# Altium schematic sheet USB-C.SchDoc
size A4; SheetNumber: 3; SheetTotal: 5
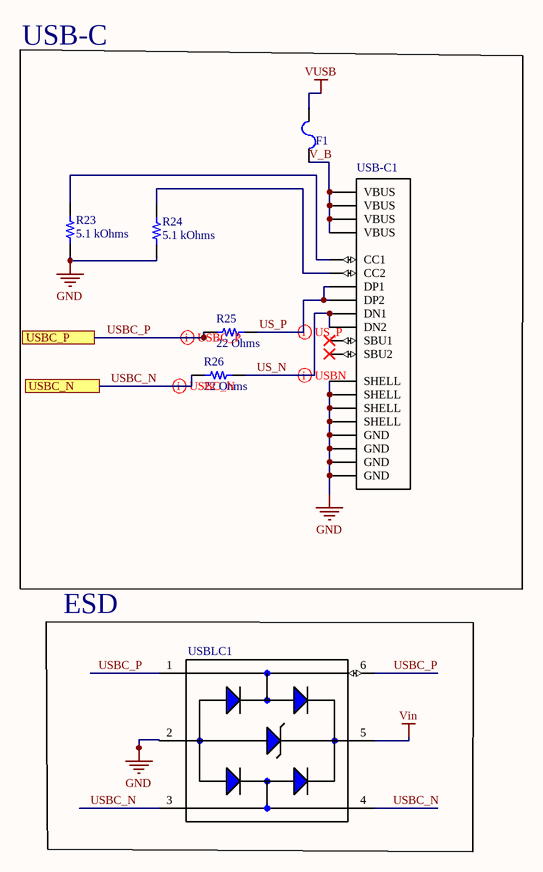
[diagram p0: USB-C.SchDoc]

## Parts
F1  MFU1206FF00750P100  [FUSE 1206_3216 0.6MM]  (value not drawn)
R23  5.1 kOhms  [RES 0402_1005]
R24  5.1 kOhms  [RES 0402_1005]
R25  22 Ohms  [RES 0402_1005]
R26  22 Ohms  [RES 0402_1005]
USB-C1  USB4085-GF-A_REVA4  [Conn Type C 2.0]  (value not drawn)
USBLC1  USBLC6-2SC6  [USBLC6-2SC6]  (value not drawn)

## Blocks framed on the sheet
USB-C: F1 R23-R26 USB-C1
ESD: USBLC1

## Ports
USBC_N, USBC_P

## Nets
GND: R23.1 R24.1 USB-C1.A1(GND) USB-C1.A12(GND) USB-C1.B1(GND) USB-C1.B12(GND) USB-C1.S1(SHELL) USB-C1.S2(SHELL) USB-C1.S3(SHELL) USB-C1.S4(SHELL) USBLC1.2(GND)
Vin: USBLC1.5(VBUS)
VUSB: F1.2
US_N: R26.2 USB-C1.A7(DN1) USB-C1.B7(DN2)
US_P: R25.2 USB-C1.A6(DP1) USB-C1.B6(DP2)
USBC_N: R26.1 USBLC1.3(I/O2_IN) USBLC1.4(I/O2_OUT) ; port USBC_N
USBC_P: R25.1 USBLC1.1(I/O1_IN) USBLC1.6(I/O1_OUT) ; port USBC_P
V_B: F1.1 USB-C1.A4(VBUS) USB-C1.A9(VBUS) USB-C1.B4(VBUS) USB-C1.B9(VBUS)
NetR23_2: R23.2 USB-C1.A5(CC1)
NetR24_2: R24.2 USB-C1.B5(CC2)

Not connected (* = marked no-connect by the designer): USB-C1 A8(SBU1)* B8(SBU2)*

## Layout directives
differential pair: US_N, US_P, USBC_N, USBC_P

## Library data of the parts
F1 = MFU1206FF00750P100: FUSE BOARD MNT 750MA 63VDC 1206; Manufacturer: Vishay Beyschlag; Approval Agency: UL; Breaking Capacity @ Rated Voltage: 50A; Fuse Type: Board Mount (Cartridge Style Excluded); Melting I²t: 0.0022; Response Time: Fast Blow; Voltage Rating - DC: 63V; Part Number: MFU1206FF00750P100; Approvals: UL; ComponentLink1Description: Datasheet; ComponentLink1URL: http://www.vishay.com/docs/28747/mfuserie.pdf; ComponentLink2Description: DigiKey Link; ComponentLink2URL: http://digikey.com/product-detail/en/vishay-beyschlag/MFU1206FF00750P100/MFU1206.75CT-ND/1206559; Current Rating (Amps): 750mA; Device Package: 1206 (3216 Metric); LastUpdated: 02/09/2020 1:30:46 AM; Lifecycle Status: Active; Minimum Order: 1; Mounting Type: Surface Mount; Operating Temperature: -55°C ~ 125°C; Package / Case: 1206 (3216 Metric); Packaging: TapeAndReel; Part Status: Active; Price: 0.40; Series: MFU; Size / Dimension: 0.126" L x 0.063" W x 0.022" H (3.20mm x 1.60mm x 0.55mm); Supplier 1: DigiKey; Supplier Part Number 1: MFU1206.75CT-ND
R23 R24 = TNPU04025K10BZEP00: TNPU0402 5K1 0.1% T-16 EP1 E3; Manufacturer: Vishay Dale; Power (Watts): 0.063W, 1/16W; Temperature Coefficient: ±5ppm/°C; Part Number: TNPU04025K10BZEP00; Value: 5.1 kOhms; ComponentLink1Description: Datasheet; ComponentLink1URL: https://www.vishay.com/docs/28779/tnpue3.pdf; ComponentLink2Description: DigiKey Link; ComponentLink2URL: https://www.digikey.com/en/products/detail/vishay-dale/TNPU04025K10BZEP00/13930447; Composition: Thin Film; Device Package: 0402 (1005 Metric); Features: Anti-Sulfur, Automotive AEC-Q200, Moisture Resistant; Height - Seated (Max): 0.016" (0.40mm); LastUpdated: 09/02/2024 8:28:37 PM; Lifecycle Status: Active; Minimum Order: 1; Number of Terminations: 2; Operating Temperature: -55°C ~ 125°C; Package / Case: 0402 (1005 Metric); Packaging: TapeAndReel; PartId: 74902; Part Status: Active; Price: 0.67; Ratings: AEC-Q200; Resistance: 5.1 kOhms; Series: TNPU e3; Size / Dimension: 0.039" L x 0.020" W (1.00mm x 0.50mm); Supplier 1: DigiKey; Supplier Part Number 1: 541-TNPU04025K10BZEP00CT-ND; Supplier Device Package: 0402; Tolerance: ±0.1%
R25 R26 = RC0402FR-7W22RL: RES 22 OHM 1% 1/8W 0402; Manufacturer: Yageo; Power (Watts): 0.125W, 1/8W; Temperature Coefficient: ±200ppm/°C; Part Number: RC0402FR-7W22RL; Value: 22 Ohms; ComponentLink1Description: Datasheet; ComponentLink1URL: https://www.yageo.com/upload/media/product/products/datasheet/rchip/PYu-RC_Group_51_RoHS_L_12.pdf; ComponentLink2Description: DigiKey Link; ComponentLink2URL: https://www.digikey.com/en/products/detail/yageo/RC0402FR-7W22RL/17013613; Composition: Thick Film; Device Package: 0402 (1005 Metric); Features: Moisture Resistant; Height - Seated (Max): 0.016" (0.40mm); LastUpdated: 06/04/2026 7:40:17 PM; Lifecycle Status: Active; Minimum Order: 1; Number of Terminations: 2; Operating Temperature: -55°C ~ 155°C; Package / Case: 0402 (1005 Metric); Packaging: CutTape; PartId: 90516; Price: 0.01; Resistance: 22 Ohms; Series: RC_L; Size / Dimension: 0.039" L x 0.020" W (1.00mm x 0.50mm); Supplier 1: DigiKey; Supplier Part Number 1: 13-RC0402FR-7W22RLCT-ND; Supplier Device Package: 0402; Tolerance: ±1%
USB-C1 = USB4085-GF-A_REVA4: USB-C (USB TYPE-C) USB 2.0 Receptacle Connector 24 (16+8 Dummy) Position Through Hole, Right Angle, low cost, 3.46mm profile, 16 pin, horizontal, Top mount; MF: Global Connector Technology; Package: None; Price: None; Check_prices: https://www.snapeda.com/parts/USB4085-GF-A/Global+Connector+Technology/view-part/?ref=eda; SnapEDA_Link: https://www.snapeda.com/parts/USB4085-GF-A/Global+Connector+Technology/view-part/?ref=snap; MP: USB4085-GF-A; Availability: In Stock; Purchase-URL: https://www.snapeda.com/api/url_track_click_mouser/?unipart_id=2780390&manufacturer=Global Connector Technology&part_name=USB4085-GF-A&search_term=usb4085-gf-a; Value: *
USBLC1 = USBLC6-2SC6: 17V Clamp 5A (8/20Âµs) Ipp Tvs Diode Surface Mount SOT-23-6; MF: STMicroelectronics; Package: SOT-23-6 STMicroelectronics; Price: None; SnapEDA_Link: https://www.snapeda.com/parts/USBLC6-2SC6/STMicroelectronics/view-part/?ref=snap; MP: USBLC6-2SC6; Availability: In Stock; Check_prices: https://www.snapeda.com/parts/USBLC6-2SC6/STMicroelectronics/view-part/?ref=eda; Value: *